# Altium schematic sheet JTAG_Switch.SchDoc: =DocumentName
size A3; SPICEModelCacheVGBTAUBO: <root> / <DocumentId>VGBTAUBO</DocumentId> / </root>; DocumentNumber: 1; Revision: 0; SheetNumber: 11; SheetTotal: 30
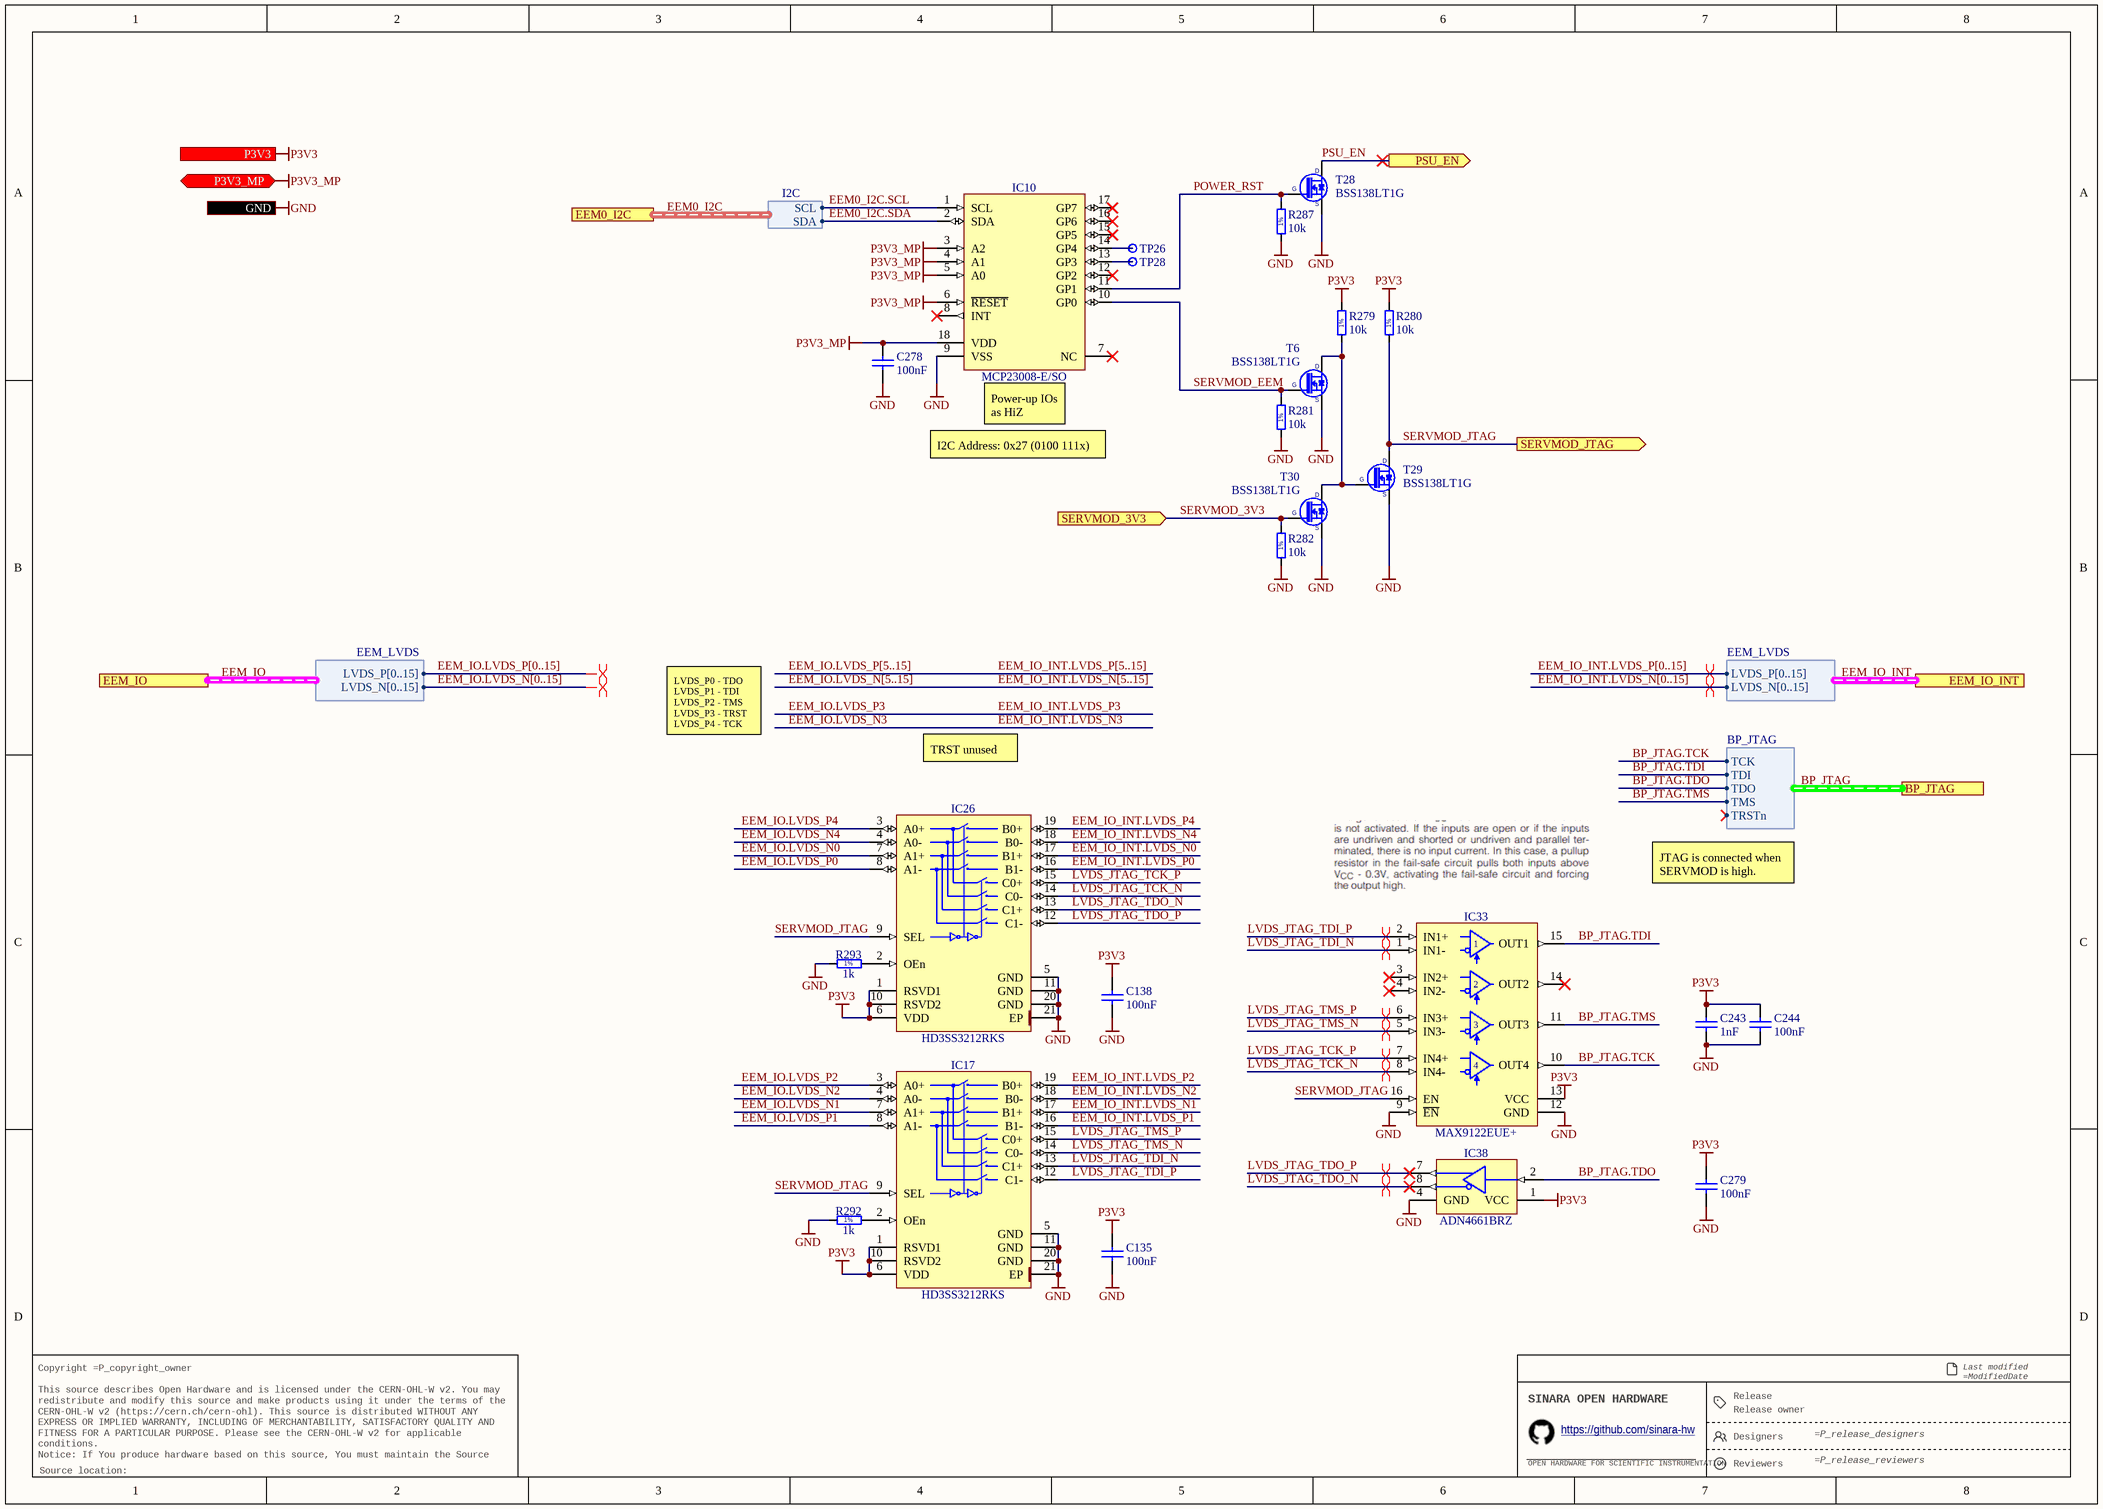
[diagram p0: JTAG_Switch.SchDoc]

## Parts
C135  100nF  [CAPC1005X55N]
C138  100nF  [CAPC1005X55N]
C243  1nF  [CAPC1005X55N]
C244  100nF  [CAPC1005X55N]
C278  100nF  [CAPC1005X55N]
C279  100nF  [CAPC1005X55N]
IC10  MCP23008-E/SO  [SOIC127P1030X265-18N]
IC17  HD3SS3212RKS  [TEXAS_RKS0020A]
IC26  HD3SS3212RKS  [TEXAS_RKS0020A]
IC33  MAX9122EUE+  [SOP65P640X110-16N]
IC38  ADN4661BRZ  [SOIC127P600X175-8N]
R279  10k  [RESC1005X40N]
R280  10k  [RESC1005X40N]
R281  10k  [RESC1005X40N]
R282  10k  [RESC1005X40N]
R287  10k  [RESC1005X40N]
R292  1k  [RESC1005X40N]
R293  1k  [RESC1005X40N]
T6  BSS138LT1G  [SOT95P240X110-3N]
T28  BSS138LT1G  [SOT95P240X110-3N]
T29  BSS138LT1G  [SOT95P240X110-3N]
T30  BSS138LT1G  [SOT95P240X110-3N]
TP26  Test Point  [TPS127]  (value not drawn)  (no BOM)
TP28  Test Point  [TPS127]  (value not drawn)  (no BOM)

## Ports
BP_JTAG (harness BP_JTAG), EEM0_I2C (harness I2C), EEM_IO (harness EEM_LVDS), EEM_IO_INT (harness EEM_LVDS), GND, P3V3 (out), P3V3_MP (bidir), PSU_EN (out), SERVMOD_3V3 (in), SERVMOD_JTAG (out)

## Harnesses
EEM_LVDS: LVDS_P[0..15], LVDS_N[0..15]
BP_JTAG: TCK, TDI, TDO, TMS, TRSTn
I2C: SDA, SCL

## Nets
GND: C135.1 C138.1 C243.1 C244.1 C278.1 C279.1 IC10.9(VSS) IC17.5(GND) IC17.11(GND) IC17.20(GND) IC17.21(EP) IC26.5(GND) IC26.11(GND) IC26.20(GND) IC26.21(EP) IC33.9(~{EN}) IC33.12(GND) IC38.4(GND) R281.2 R282.2 R287.2 R292.2 R293.2 T6.2(S) T28.2(S) T29.2(S) T30.2(S) ; port GND
P3V3: C135.2 C138.2 C243.2 C244.2 C279.2 IC17.1(RSVD1) IC17.6(VDD) IC17.10(RSVD2) IC26.1(RSVD1) IC26.6(VDD) IC26.10(RSVD2) IC33.13(VCC) IC38.1(VCC) R279.1 R280.1 ; port P3V3
P3V3_MP: C278.2 IC10.3(A2) IC10.4(A1) IC10.5(A0) IC10.6(~{RESET}) IC10.18(VDD) ; port P3V3_MP
BP_JTAG.TCK: IC33.10(OUT4) ; port BP_JTAG.TCK
BP_JTAG.TDI: IC33.15(OUT1) ; port BP_JTAG.TDI
BP_JTAG.TDO: IC38.2(DIN) ; port BP_JTAG.TDO
BP_JTAG.TMS: IC33.11(OUT3) ; port BP_JTAG.TMS
EEM0_I2C.SCL: IC10.1(SCL) ; port EEM0_I2C.SCL
EEM0_I2C.SDA: IC10.2(SDA) ; port EEM0_I2C.SDA
EEM_IO.LVDS_N0: IC26.7(A1+)
EEM_IO.LVDS_N1: IC17.7(A1+)
EEM_IO.LVDS_N2: IC17.4(A0-)
EEM_IO.LVDS_N4: IC26.4(A0-)
EEM_IO.LVDS_P0: IC26.8(A1-)
EEM_IO.LVDS_P1: IC17.8(A1-)
EEM_IO.LVDS_P2: IC17.3(A0+)
EEM_IO.LVDS_P4: IC26.3(A0+)
EEM_IO_INT.LVDS_N0: IC26.17(B1+)
EEM_IO_INT.LVDS_N1: IC17.17(B1+)
EEM_IO_INT.LVDS_N2: IC17.18(B0-)
EEM_IO_INT.LVDS_N4: IC26.18(B0-)
EEM_IO_INT.LVDS_P0: IC26.16(B1-)
EEM_IO_INT.LVDS_P1: IC17.16(B1-)
EEM_IO_INT.LVDS_P2: IC17.19(B0+)
EEM_IO_INT.LVDS_P4: IC26.19(B0+)
LVDS_JTAG_TCK_N: IC26.14(C0-) IC33.8(IN4-)
LVDS_JTAG_TCK_P: IC26.15(C0+) IC33.7(IN4+)
LVDS_JTAG_TDI_N: IC17.13(C1+) IC33.1(IN1-)
LVDS_JTAG_TDI_P: IC17.12(C1-) IC33.2(IN1+)
LVDS_JTAG_TDO_N: IC26.13(C1+) IC38.8(DOUT-)
LVDS_JTAG_TDO_P: IC26.12(C1-) IC38.7(DOUT+)
LVDS_JTAG_TMS_N: IC17.14(C0-) IC33.5(IN3-)
LVDS_JTAG_TMS_P: IC17.15(C0+) IC33.6(IN3+)
POWER_RST: IC10.11(GP1) R287.1 T28.1(G)
PSU_EN: T28.3(D) ; port PSU_EN
SERVMOD_3V3: R282.1 T30.1(G) ; port SERVMOD_3V3
SERVMOD_EEM: IC10.10(GP0) R281.1 T6.1(G)
SERVMOD_JTAG: IC17.9(SEL) IC26.9(SEL) IC33.16(EN) R280.2 T29.3(D) ; port SERVMOD_JTAG
NetIC10_13: IC10.13(GP3) TP28.1
NetIC10_14: IC10.14(GP4) TP26.1
NetIC17_2: IC17.2(OEn) R292.1
NetIC26_2: IC26.2(OEn) R293.1
NetR279_2: R279.2 T6.3(D) T29.1(G) T30.3(D)

Not connected (* = marked no-connect by the designer): IC10 7(NC)* 8(INT)* 12(GP2)* 15(GP5)* 16(GP6)* 17(GP7)*; IC33 3(IN2+)* 4(IN2-)* 14(OUT2)*; IC38 3(NC) 5(NC) 6(NC)

## Buses and harness runs
bus EEM_IO.LVDS_N[0..15]
bus EEM_IO.LVDS_N[5..15] = EEM_IO_INT.LVDS_N[5..15]
bus EEM_IO.LVDS_P[0..15]
bus EEM_IO.LVDS_P[5..15] = EEM_IO_INT.LVDS_P[5..15]
bus EEM_IO_INT.LVDS_N[0..15]
bus EEM_IO_INT.LVDS_P[0..15]
harness BP_JTAG = port BP_JTAG
harness EEM0_I2C = port EEM0_I2C
harness EEM_IO = port EEM_IO
harness EEM_IO_INT = port EEM_IO_INT

## Layout directives
differential pair; differential pair class Diff_100Ohm: (no net found under the mark), LVDS_JTAG_TCK_N, LVDS_JTAG_TCK_P, LVDS_JTAG_TDI_N, LVDS_JTAG_TDI_P, LVDS_JTAG_TDO_N, LVDS_JTAG_TDO_P, LVDS_JTAG_TMS_N, LVDS_JTAG_TMS_P

## Notes on the sheet
- I2C Address: 0x27 (0100 111x)
- (near IC10) Power-up IOs as HiZ
- LVDS_P0 - TDO
  LVDS_P1 - TDI
  LVDS_P2 - TMS
  LVDS_P3 - TRST
  LVDS_P4 - TCK
- TRST unused
- JTAG is connected when SERVMOD is high.
- Release
- Last modified =ModifiedDate
  Sheet =sheetnumber of =sheettotal · Size A3
- Copyright =P_copyright_owner
  This source describes Open Hardware and is licensed under the CERN-OHL-W v2. You may redistribute and modify this source and make products using it under the terms of the CERN-OHL-W v2 (https://cern.ch/cern-ohl). This source is distributed WITHOUT ANY EXPRESS OR IMPLIED WARRANTY, INCLUDING OF MERCHANTABILITY, SATISFACTORY QUALITY AND FITNESS FOR A PARTICULAR PURPOSE. Please see the CERN-OHL-W v2 for applicable conditions.
  Notice: If You produce hardware based on this source, You must maintain the Source Location visible on the product, its packaging or its documentation.
- SINARA OPEN HARDWARE
- OPEN HARDWARE FOR SCIENTIFIC INSTRUMENTATION
- https://github.com/sinara-hw
- Release owner
- Designers
- Reviewers
- Source location:
- (in symbol R0402_1K_1%_0.0625W_100PPM) 1%
- (in symbol R0402_10K_1%_0.0625W_100PPM) 1%

## Library data of the parts
C135 C138 C244 C278 C279 = CC0402_100NF_50V_10%_X7R: Non-polarised capacitor; Part Description: SMD Multilayer Chip Ceramic Capacitor; Manufacturer: GENERIC; Manufacturer1 Part Number: GRM155R71H104KE14D; Voltage: 50V; TC: X7R; Tolerance: ±10%; Part Number: CC0402_100NF_50V_10%_X7R; Component Kind: Standard; Component Type: Standard; Pin Count: 2; Value: 100nF; Status: None; Manufacturer Part Number: CC0402_100NF_50V_10%_X7R; Case: 0402; Mounted: Yes; Socket: No; SMD: Yes; Sense: No; Manufacturer1 Example: MURATA; Manufacturer1 ComponentHeight: 0.55mm; HelpURL: \\cern.ch\dfs\Applications\Altium\Datasheets\CC0402_MURATA_GRM155R71H104KE14D.pdf; Author: CERN DEM MR; CreateDate: 30.06.2017; LatestRevisionDate: 30.06.2017
C243 = CC0402_1NF_50V_10%_X7R: Non-polarised capacitor; Part Description: SMD Multilayer Chip Ceramic Capacitor; Manufacturer: GENERIC; Manufacturer1 Part Number: 223858715623; Voltage: 50V; TC: X7R; Tolerance: ±10%; Part Number: CC0402_1NF_50V_10%_X7R; Component Kind: Standard; Component Type: Standard; Pin Count: 2; Value: 1nF; Status: Not Recommended; Manufacturer Part Number: CC0402_1NF_50V_10%_X7R; Case: 0402; Mounted: Yes; Socket: No; SMD: Yes; Sense: No; Manufacturer1 Example: PHYCOMP; Manufacturer1 ComponentHeight: 0.55mm; HelpURL: \\cern.ch\dfs\Applications\Altium\Datasheets\CC0402_X7R_PHYCOMP.pdf; Author: CERN DEM JLC; CreateDate: 2007-12-03; LatestRevisionDate: 2007-12-03
IC10 = MCP23008-E/SO: 8-Bit I/O Expander with Serial Interface; Manufacturer: MICROCHIP TECHNOLOGY; PressFit: No; Bonding: No; Part Number: MCP23008-E/SO; Component Kind: Standard; Component Type: Standard; Device: MCP23008-E/SO; PackageDescription: SOIC, 18-Leads, Body 13.9x7.6mm (max), Pitch 1.27mm, IPC Medium Density; Part Description: 8-Bit I/O Expander with Serial Interface; Manufacturer Part Number: MCP23008-E/SO; Pin Count: 18; Case: SOIC18; Mounted: Yes; Socket: No; SMD: Yes; Sense: No; ComponentHeight: 2.65mm; Author: CERN DEM JLC; HelpURL: \\cern.ch\dfs\Applications\Altium\Datasheets\MCP23008-E-SO.pdf; CreateDate: 30/10/2012; LatestRevisionDate: 30/10/2012
IC17 IC26 = HD3SS3212RKS: Two-Channel Differential 2:1/1:2 USB3.1 Mux/Demux; Manufacturer: TEXAS INSTRUMENTS; PressFit: No; Bonding: No; Part Number: HD3SS3212RKS; Component Kind: Standard; Component Type: Standard; Device: HD3SS3212RKS; PackageDescription: QFN, TEXAS Case Style RKS, 0.50mm Pitch, Rect.; 20 Pin, 2.50mm L X 4.50mm W X 1.00mm H body (w/Thermal Tab 1.1mm X 3.1mm); Part Description: Two-Channel Differential 2:1/1:2 USB3.1 Mux/Demux; Manufacturer Part Number: HD3SS3212RKS; Pin Count: 21; Case: TQFN20; Mounted: Yes; Socket: No; SMD: Yes; Sense: No; ComponentHeight: 1mm; Author: CERN DEM BC; HelpURL: \\cern.ch\dfs\Applications\Altium\Datasheets\HD3SS3212RKS.pdf; CreateDate: 2019-11-06; LatestRevisionDate: 2019-11-06
IC33 = MAX9122EUE+: Quad LVDS Line Receivers with Integrated Termination and Flow-Through Pinout; Manufacturer: MAXIM; PressFit: No; Bonding: No; Part Number: MAX9122EUE+; Component Kind: Standard; Component Type: Standard; Device: MAX9122EUE+; PackageDescription: SOP, 0.65mm Pitch; 16 Pin, 4.40mm W X 5.00mm L X 1.10mm H body, IPC Medium Density; Part Description: Quad LVDS Line Receivers with Integrated Termination and Flow-Through Pinout; Manufacturer Part Number: MAX9122EUE+; Pin Count: 16; Case: TSSOP16; Mounted: Yes; Socket: No; SMD: Yes; Sense: No; ComponentHeight: 1.1mm; Author: CERN DEM MR; HelpURL: \\cern.ch\dfs\Applications\Altium\Datasheets\MAX9122EUE+.pdf; CreateDate: 2015-12-14; LatestRevisionDate: 2015-12-14
IC38 = ADN4661BRZ: Single, 3V, CMOS, LVDS, High Speed Differential Driver; Manufacturer: ANALOG DEVICES; PressFit: No; Bonding: No; Part Number: ADN4661BRZ; Component Kind: Standard; Component Type: Standard; Device: ADN4661BRZ; PackageDescription: SOIC 8, Pitch 1.27mm - Body 4x5mm, IPC Medium Density; Part Description: Single, 3V, CMOS, LVDS, High Speed Differential Driver; Manufacturer Part Number: ADN4661BRZ; Pin Count: 8; Case: SOIC8; Mounted: Yes; Socket: No; SMD: Yes; Sense: No; ComponentHeight: 1.75mm; Author: CERN DEM JMW; HelpURL: \\cern.ch\dfs\Applications\Altium\Datasheets\ADN4661BRZ.pdf; CreateDate: 2014-02-26; LatestRevisionDate: 2014-02-26
R279-R282 R287 = R0402_10K_1%_0.0625W_100PPM: Resistor - 1%; Part Description: General Purpose Thick Film Chip Resistor; Manufacturer: GENERIC; Manufacturer1 Part Number: 232270671003L; TC: ±100ppm/°C; Part Number: R0402_10K_1%_0.0625W_100PPM; Component Kind: Standard; Component Type: Standard; Pin Count: 2; Value: 10k; Status: Not recommended; Power: 0.0625W; Tolerance: ±1%; Manufacturer Part Number: R0402_10K_1%_0.0625W_100PPM; Case: 0402; Mounted: Yes; Sense: No; Socket: No; SMD: Yes; Manufacturer1 Example: YAGEO PHYCOMP; Manufacturer1 ComponentHeight: 0.4mm; HelpURL: \\cern.ch\dfs\Applications\Altium\Datasheets\R0402_Phycomp_RC0402.pdf; Author: CERN DEM JLC; CreateDate: 03.12.2007; LatestRevisionDate: 17.10.2012
R292 R293 = R0402_1K_1%_0.0625W_100PPM: Resistor - 1%; Part Description: General Purpose Thick Film Chip Resistor; Manufacturer: GENERIC; Manufacturer1 Part Number: 232270671002L; TC: ±100ppm/°C; PressFit: No; Part Number: R0402_1K_1%_0.0625W_100PPM; Component Kind: Standard; Component Type: Standard; Pin Count: 2; Value: 1k; Status: Not Recommended; Power: 0.0625W; Tolerance: ±1%; Manufacturer Part Number: R0402_1K_1%_0.0625W_100PPM; Case: 0402; Mounted: Yes; Sense: No; Socket: No; SMD: Yes; Manufacturer1 Example: YAGEO PHYCOMP; Manufacturer1 ComponentHeight: 0.4mm; HelpURL: \\cern.ch\dfs\Applications\Altium\Datasheets\R0402_Phycomp_RC0402.pdf; Author: CERN DEM JLC; CreateDate: 2007-12-03; LatestRevisionDate: 2012-10-17
T6 T28-T30 = BSS138LT1G: N-CHANNEL MOSFET WITH DIODE; Part Description: 50V, 200mA N-Channel Enhancement Mode Field-Effect Transistor; Manufacturer: ON SEMICONDUCTOR; PressFit: No; Bonding: No; Part Number: BSS138LT1G; Component Kind: Standard; Component Type: Standard; Device: BSS138LT1G; PackageDescription: SOT23, 0.95mm Pitch; 3 Pin, 1.40mm W X 3.00mm L X 1.10mm H body, IPC Medium Density; Manufacturer Part Number: BSS138L; Pin Count: 3; Case: SOT23-3; Mounted: Yes; Socket: No; SMD: Yes; Sense: No; ComponentHeight: 1.11mm; HelpURL: \\cern.ch\dfs\Applications\Altium\Datasheets\BSS138LT1G.pdf; Author: CERN DEM JLC; CreateDate: 23.03.2009; LatestRevisionDate: 25.05.2022
TP26 TP28 = SMD_PAD_1.27X1.27MM: Part Description: 1.27mm x 1.27mm PCB Copper Area (SMD Test Point); Mounted: No; Part Number: SMD_PAD_1.27X1.27MM; Component Type: Standard (No BOM); Pin Count: 1; Family: Test Point; Socket: No; SMD: Yes; Sense: No; Status: None; ComponentHeight: 0mm; HelpURL: Undefined; Author: CERN DEM JLC; CreateDate: 12.01.2008; LatestRevisionDate: 12.01.2008; PackageDescription: 1.27mm x 1.27mm PCB Copper Area (SMD Test Point)